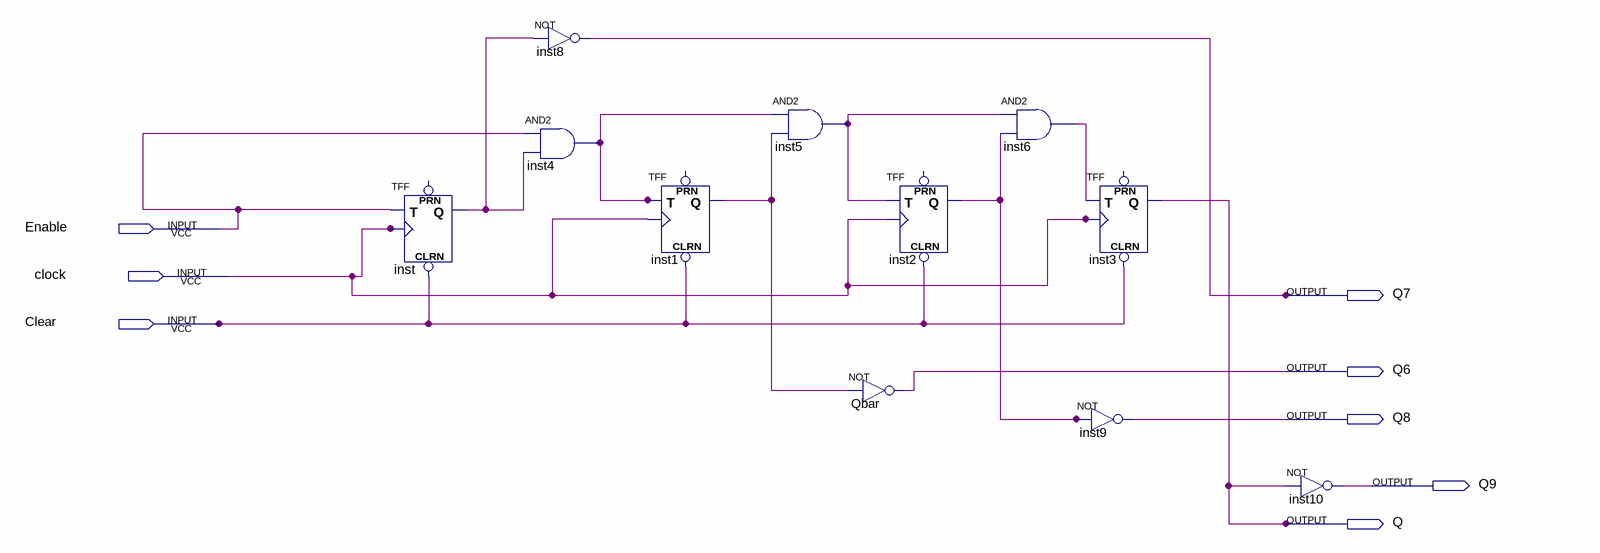
[diagram p0: schematic sheet]
// Quartus schematic part14bit.bdf as structural Verilog: 11 symbols, 8 pins
module part14bit (
  input  Enable,
  input  clock,
  input  Clear,
  output Q7,
  output Q6,
  output Q8,
  output Q9,
  output Q
);

  wire inst1_q, inst2_q, inst4_out, inst5_out, inst6_out, inst_q;

  TFF inst (.CLRN(Clear), .T(Enable), .CLK(clock), .Q(inst_q));  // open: PRN
  not inst8 (Q7, inst_q);
  and inst4 (inst4_out, Enable, inst_q);
  TFF inst1 (.CLRN(Clear), .T(inst4_out), .CLK(clock), .Q(inst1_q));  // open: PRN
  and inst5 (inst5_out, inst4_out, inst1_q);
  not Qbar (Q6, inst1_q);
  TFF inst2 (.CLRN(Clear), .T(inst5_out), .CLK(clock), .Q(inst2_q));  // open: PRN
  and inst6 (inst6_out, inst5_out, inst2_q);
  TFF inst3 (.CLRN(Clear), .T(inst6_out), .CLK(clock), .Q(Q));  // open: PRN
  not inst9 (Q8, inst2_q);
  not inst10 (Q9, Q);
endmodule
